# Altium schematic sheet SDR_LO.SchDoc
size B; SheetNumber: 2; SheetTotal: 4
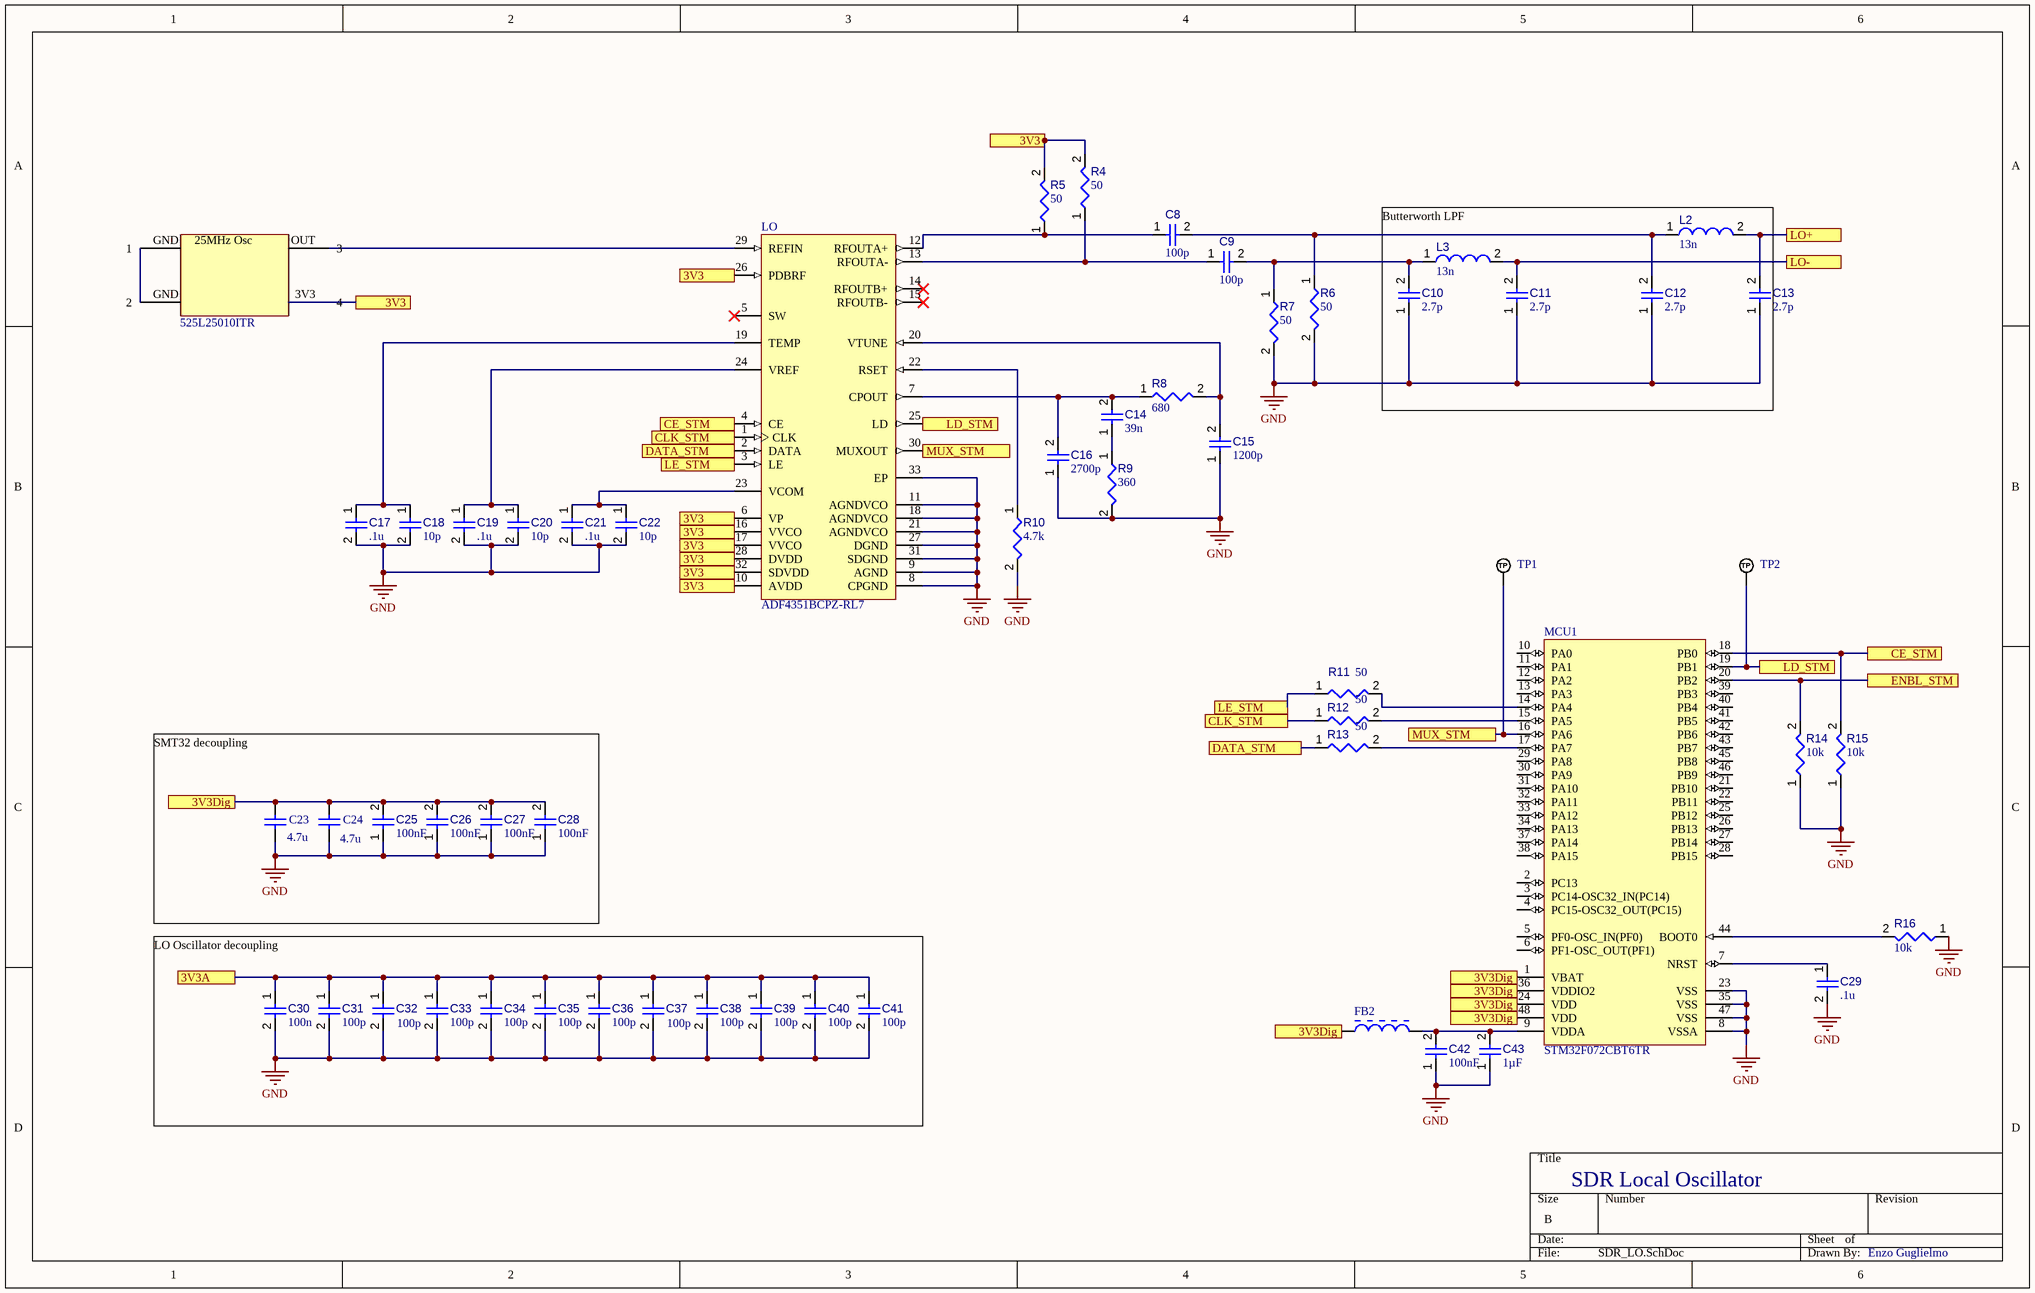
[diagram p0: SDR_LO.SchDoc]

## Parts
*  525L25010ITR
C8  value 100p  [CAPC0402(1005)60_L]  (hidden comment: Capacitor 100nF +/-20% 25V 0402)
C9  value 100p  [CAPC0402(1005)60_L]  (hidden comment: Capacitor 100nF +/-20% 25V 0402)
C10  value 2.7p  [CAPC0402(1005)60_L]  (hidden comment: Capacitor 100nF +/-20% 25V 0402)
C11  value 2.7p  [CAPC0402(1005)60_L]  (hidden comment: Capacitor 100nF +/-20% 25V 0402)
C12  value 2.7p  [CAPC0402(1005)60_L]  (hidden comment: Capacitor 100nF +/-20% 25V 0402)
C13  value 2.7p  [CAPC0402(1005)60_L]  (hidden comment: Capacitor 100nF +/-20% 25V 0402)
C14  value 39n  [CAPC0402(1005)60_L]  (hidden comment: Capacitor 100nF +/-20% 25V 0402)
C15  value 1200p  [CAPC0402(1005)60_L]  (hidden comment: Capacitor 100nF +/-20% 25V 0402)
C16  value 2700p  [CAPC0402(1005)60_L]  (hidden comment: Capacitor 100nF +/-20% 25V 0402)
C17  value .1u  [CAPC0402(1005)60_L]  (hidden comment: Capacitor 100nF +/-20% 25V 0402)
C18  value 10p  [CAPC0402(1005)60_L]  (hidden comment: Capacitor 100nF +/-20% 25V 0402)
C19  value .1u  [CAPC0402(1005)60_L]  (hidden comment: Capacitor 100nF +/-20% 25V 0402)
C20  value 10p  [CAPC0402(1005)60_L]  (hidden comment: Capacitor 100nF +/-20% 25V 0402)
C21  value .1u  [CAPC0402(1005)60_L]  (hidden comment: Capacitor 100nF +/-20% 25V 0402)
C22  value 10p  [CAPC0402(1005)60_L]  (hidden comment: Capacitor 100nF +/-20% 25V 0402)
C23  4.7u  [WCAP-CSGP_0402_L1W0.5H0.5]
C24  4.7u  [WCAP-CSGP_0402_L1W0.5H0.5]
C25  value 100nF  [CAPC0402(1005)60_L]  (hidden comment: Capacitor 100nF +/-20% 10V 0402)
C26  value 100nF  [CAPC0402(1005)60_L]  (hidden comment: Capacitor 100nF +/-20% 10V 0402)
C27  value 100nF  [CAPC0402(1005)60_L]  (hidden comment: Capacitor 100nF +/-20% 10V 0402)
C28  value 100nF  [CAPC0402(1005)60_L]  (hidden comment: Capacitor 100nF +/-20% 10V 0402)
C29  value .1u  [CAPC0402(1005)60_L]  (hidden comment: Capacitor 100nF +/-20% 25V 0402)
C30  value 100n  [CAPC0402(1005)60_L]  (hidden comment: Capacitor 100nF +/-20% 25V 0402)
C31  value 100p  [CAPC0402(1005)60_L]  (hidden comment: Capacitor 100nF +/-20% 25V 0402)
C32  value 100p  [CAPC0402(1005)60_L]  (hidden comment: Capacitor 100nF +/-20% 25V 0402)
C33  value 100p  [CAPC0402(1005)60_L]  (hidden comment: Capacitor 100nF +/-20% 25V 0402)
C34  value 100p  [CAPC0402(1005)60_L]  (hidden comment: Capacitor 100nF +/-20% 25V 0402)
C35  value 100p  [CAPC0402(1005)60_L]  (hidden comment: Capacitor 100nF +/-20% 25V 0402)
C36  value 100p  [CAPC0402(1005)60_L]  (hidden comment: Capacitor 100nF +/-20% 25V 0402)
C37  value 100p  [CAPC0402(1005)60_L]  (hidden comment: Capacitor 100nF +/-20% 25V 0402)
C38  value 100p  [CAPC0402(1005)60_L]  (hidden comment: Capacitor 100nF +/-20% 25V 0402)
C39  value 100p  [CAPC0402(1005)60_L]  (hidden comment: Capacitor 100nF +/-20% 25V 0402)
C40  value 100p  [CAPC0402(1005)60_L]  (hidden comment: Capacitor 100nF +/-20% 25V 0402)
C41  value 100p  [CAPC0402(1005)60_L]  (hidden comment: Capacitor 100nF +/-20% 25V 0402)
C42  value 100nF  [CAPC0402(1005)60_L]  (hidden comment: Capacitor 100nF +/-20% 10V 0402)
C43  value 1µF  [CAPC0402(1005)60_L]  (hidden comment: Capacitor 1µF +/-20% 10V 0402)
FB2  BLM21PG331SN1D  [INDC2013X105X50ML20T20]  (value not drawn)
L2  value 13n  [IND1005X55X20VL5T10]  (hidden comment: ELJ-RF2N2DFB)
L3  value 13n  [IND1005X55X20VL5T10]  (hidden comment: ELJ-RF2N2DFB)
LO  ADF4351BCPZ-RL7  [ADI-CP-32-2_L]
MCU1  STM32F072CBT6TR  [STM-LQFP48_M]
R4  value 50  [RESC1005X40X25ML05T05]  (hidden comment: Resistor 100k +/-1% 0402 63 mW)
R5  value 50  [RESC1005X40X25ML05T05]  (hidden comment: Resistor 100k +/-1% 0402 63 mW)
R6  value 50  [RESC1005X40X25ML05T05]  (hidden comment: Resistor 100k +/-1% 0402 63 mW)
R7  value 50  [RESC1005X40X25ML05T05]  (hidden comment: Resistor 100k +/-1% 0402 63 mW)
R8  value 680  [RESC1005X40X25ML05T05]  (hidden comment: Resistor 100k +/-1% 0402 63 mW)
R9  value 360  [RESC1005X40X25ML05T05]  (hidden comment: Resistor 100k +/-1% 0402 63 mW)
R10  value 4.7k  [RESC1005X40X25ML05T05]  (hidden comment: Resistor 100k +/-1% 0402 63 mW)
R11  value 50  [RESC1005X40X25ML05T05]  (hidden comment: Resistor 100k +/-1% 0402 63 mW)
R12  value 50  [RESC1005X40X25ML05T05]  (hidden comment: Resistor 100k +/-1% 0402 63 mW)
R13  value 50  [RESC1005X40X25ML05T05]  (hidden comment: Resistor 100k +/-1% 0402 63 mW)
R14  value 10k  [RESC1005X40X25ML05T05]  (hidden comment: Resistor 100k +/-1% 0402 63 mW)
R15  value 10k  [RESC1005X40X25ML05T05]  (hidden comment: Resistor 100k +/-1% 0402 63 mW)
R16  value 10k  [RESC1005X40X25ML05T05]  (hidden comment: Resistor 100k +/-1% 0402 63 mW)
TP1  TP_NOBOM  [PAD_RND_1MM]  (value not drawn)  (no BOM)
TP2  TP_NOBOM  [PAD_RND_1MM]  (value not drawn)  (no BOM)

## Ports
3V3 (see SDR_LO[2A], SDR_LO[3A], SDR_LO[3B]), 3V3 (see SDR_LO[3A], SDR_LO[3B]), 3V3A (see SDR_Power[2C]), 3V3Dig (see SDR_LO[1C], SDR_LO[4D], SDR_LO[5D], SDR_Power[2D]), 3V3Dig (see SDR_LO[1C], SDR_LO[5D], SDR_Power[2D]), 3V3Dig (see SDR_LO[4D], SDR_LO[5D], SDR_Power[2D]), CE_STM (see SDR_LO[2B]), CE_STM (see SDR_LO[6C]), CLK_STM (see SDR_LO[2B]), CLK_STM (see SDR_LO[4C]), DATA_STM (see SDR_LO[2B]), DATA_STM (see SDR_LO[4C]), ENBL_STM (see SDR_Tuner[3A]), LD_STM (see SDR_LO[3B]), LD_STM (see SDR_LO[6C]), LE_STM (see SDR_LO[2B]), LE_STM (see SDR_LO[4C]), LO+ (see SDR_Tuner[3A]), LO- (see SDR_Tuner[3A]), MUX_STM (see SDR_LO[3B]), MUX_STM (see SDR_LO[5C])

## Nets
GND: C10.1 C11.1 C12.1 C13.1 C15.1 C16.1 C17.2 C18.2 C19.2 C20.2 C21.2 C22.2 C23.1 C24.1 C25.1 C26.1 C27.1 C28.1 C29.2 C30.2 C31.2 C32.2 C33.2 C34.2 C35.2 C36.2 C37.2 C38.2 C39.2 C40.2 C41.2 C42.1 C43.1 LO.8(CPGND) LO.9(AGND) LO.11(AGNDVCO) LO.18(AGNDVCO) LO.21(AGNDVCO) LO.27(DGND) LO.31(SDGND) LO.33(EP) MCU1.8(VSSA) MCU1.23(VSS) MCU1.35(VSS) MCU1.47(VSS) R6.2 R7.2 R9.2 R10.2 R14.1 R15.1 R16.1
3V3: *.3V3(4) LO.6(VP) LO.10(AVDD) LO.16(VVCO) LO.17(VVCO) LO.26(PDBRF) LO.28(DVDD) LO.32(SDVDD) R4.2 R5.2 ; port 3V3
3V3A: C30.1 C31.1 C32.1 C33.1 C34.1 C35.1 C36.1 C37.1 C38.1 C39.1 C40.1 C41.1 ; port 3V3A
3V3Dig: C23.2 C24.2 C25.2 C26.2 C27.2 C28.2 FB2.1 MCU1.1(VBAT) MCU1.24(VDD) MCU1.36(VDDIO2) MCU1.48(VDD) ; port 3V3Dig
CE_STM: LO.4(CE) MCU1.18(PB0) R15.2 ; port CE_STM
CLK_STM: LO.1(CLK) R12.1 ; port CLK_STM
DATA_STM: LO.2(DATA) R13.1 ; port DATA_STM
ENBL_STM: MCU1.20(PB2) R14.2 ; port ENBL_STM
LD_STM: LO.25(LD) MCU1.19(PB1) TP2.1(TP) ; port LD_STM
LE_STM: LO.3(LE) R11.1 ; port LE_STM
LO+: C13.2 L2.2 ; port LO+
LO-: C11.2 L3.2 ; port LO-
MUX_STM: LO.30(MUXOUT) MCU1.16(PA6) TP1.1(TP) ; port MUX_STM
NetC8_1: C8.1 LO.12(RFOUTA+) R5.1
NetC8_2: C8.2 C12.2 L2.1 R6.1
NetC9_1: C9.1 LO.13(RFOUTA-) R4.1
NetC9_2: C9.2 C10.2 L3.1 R7.1
NetC14_1: C14.1 R9.1
NetC14_2: C14.2 C16.2 LO.7(CPOUT) R8.1
NetC15_2: C15.2 LO.20(VTUNE) R8.2
NetC17_1: C17.1 C18.1 LO.19(TEMP)
NetC19_1: C19.1 C20.1 LO.24(VREF)
NetC21_1: C21.1 C22.1 LO.23(VCOM)
NetC29_1: C29.1 MCU1.7(NRST)
NetC42_2: C42.2 C43.2 FB2.2 MCU1.9(VDDA)
NetLO_22: LO.22(RSET) R10.1
NetMCU1_14: MCU1.14(PA4) R11.2
NetMCU1_15: MCU1.15(PA5) R12.2
NetMCU1_17: MCU1.17(PA7) R13.2
NetMCU1_44: MCU1.44(BOOT0) R16.2

Not connected (* = marked no-connect by the designer): * GND(2) OUT(3); LO 5(SW)* 14(RFOUTB+)* 15(RFOUTB-)* 29(REFIN); MCU1 2(PC13) 3(PC14-OSC32_IN(PC14)) 4(PC15-OSC32_OUT(PC15)) 5(PF0-OSC_IN(PF0)) 6(PF1-OSC_OUT(PF1)) 10(PA0) 11(PA1) 12(PA2) 13(PA3) 21(PB10) 22(PB11) 25(PB12) 26(PB13) 27(PB14) 28(PB15) 29(PA8) 30(PA9) 31(PA10) 32(PA11) 33(PA12) 34(PA13) 37(PA14) 38(PA15) 39(PB3) 40(PB4) 41(PB5) 42(PB6) 43(PB7) 45(PB8) 46(PB9)

## Notes on the sheet
- Butterworth LPF
- SMT32 decoupling
- LO Oscillator decoupling
- SDR Local Oscillator
- Enzo Guglielmo
- (in symbol 525L25010ITR) 25MHz Osc

## Library data of the parts
* = 525L25010ITR: 25 MHz TCXO Clipped Sine Wave Oscillator 3.3V 4-SMD, No Lead
C8-C22 C29-C41 = CMP-001-00065-4: Chip Capacitor, 100nF +/-20%, 25V, 0402, Thickness 0.6 mm; Tolerance: 10%; Max Operating Temperature: 85°C; Min Operating Temperature: -55°C; Pins: 2; Voltage Rating: 25V; Mounting Technology: SMT; Case/Package: 0402
C23 C24 = CMP-207839-000027-3: Cap, Mlcc, 4.7UF, 6.3V, X5R, 0402 Rohs Compliant: Yes; Insulation Resistance: 20MΩ; Capacitance: 4.7µF; Material: Ceramic; Tolerance: 20%; Case Code (Metric): 1005; Case/Package: 0402; Case Code (Imperial): 0402; RoHS: Compliant; Voltage Rating (DC): 6.3V; Thickness: 558.8µm; Dielectric: X5R; REACH SVHC: Unknown; Voltage Rating: 6.3V; Width: 500µm; Max Operating Temperature: 85°C; Height: 500µm; Mount: Surface Mount; Min Operating Temperature: -55°C; Length: 1mm
C25-C28 C42 = CMP-001-00061-3: Chip Capacitor, 100nF +/-20%, 10V, 0402, Thickness 0.6 mm; Tolerance: 20%; Mounting Technology: SMT; Voltage Rating: 10V; Max Operating Temperature: 85°C; Pins: 2; Case/Package: 0402; Min Operating Temperature: -55°C
C43 = CMP-001-00063-3: Chip Capacitor, 1µF +/-20%, 10V, 0402, Thickness 0.6 mm; Tolerance: 10%; Mounting Technology: SMT; Max Operating Temperature: 85°C; Voltage Rating: 10V; Pins: 2; Case/Package: 0402; Min Operating Temperature: -55°C
FB2 = CMP-006-00000-3: IND, Chip Ferrite Bead, 330 Ohm, +/- 25%, 1.5 A, -55 to 125 degC, 0805 (2012 Metric), Tape and Reel; Manufacturer: Murata; Current Rating: 1.5A; Impedance: 330Ohm; Resistance: 90mohm; Max Operating Temperature: 125°C; Core Material: Ferrite; Case/Package: 0805; Mounting Technology: SM; Datasheet URL: http://psearch.en.murata.com/inductor/product/LQG15HS15NJ02_.pdf; Packaging: TapeandReel; Min Operating Temperature: -55°C; RoHS Compliant: True; Max Current Rating: 1.5A; Datasheet Version: Nov-11; Package Quantity: 4000; Package Reference: 0805; Package Description: 2-Pin Surface Mount Device, Body 2 x1.25 mm; Tolerance: 25%
L2 L3 = CMP-006-00006-6: Chip Inductor, 2.2 nH, +/- 0.3 nH, 400 mA, -40 to 85 degC, 0402 (1005 Metric), RoHS, Tape and Reel; Manufacturer: Panasonic; Shielding: Unshielded; Current Rating: 400mA; Tolerance: 5%; Core Material: Ceramic; Q Factor: 8; Datasheet URL: http://www.bourns.com/docs/Product-Datasheets/cm322522.pdf; Case/Package: 0402; RoHS Compliant: True; Package Description: 2-Pin Surface Mount Device, Body 1 x 0.5 mm; Packaging: TapeandReel; Datasheet Version: Sep-12; Package Quantity: 10000; Package Reference: 0402; Min Operating Temperature: -20°C; Mounting Technology: SM; Max Operating Temperature: 85°C
LO = CMP-0287-00015-1: Wideband Synthesizer with Integrated VCO, CP-32-2, Pb-Free, 1500 Reel; Max RF Input (MHz): 4.4GHz; RF Prescalers: 4/5,8/9; Max REFin (MHz): 250MHz; Frequency Range: 35MHz-4.4GHz; Norm Phase Noise (dBc/Hz): -221dBc; Supply Current: 110mA; Single/Dual: Single; PackageVersion: Jan-2005; ComponentLink3URL: http://www.analog.com/static/imported-files/packages/414143737956480539664569CP_32_2.pdf; PackageReference: CP-32-2; ComponentLink2URL: http://www.analog.com/static/imported-files/data_sheets/ADF4351.pdf; ComponentLink1URL: www.analog.com; ComponentLink1Description: Manufacturer URL; ComponentLink2Description: Datasheet; ComponentLink3Description: Package Specification; PackageDescription: 32-Lead Lead Frame Chip Scale Package [LFCSP_VQ]; DatasheetVersion: Rev. Pr D; Code_JEDEC: MO-220-VHHD-2
MCU1 = CMP-0304-00171-1: ARM Cortex-M0 32-bit MCU, 128 KB Flash, 16 KB Internal RAM, 37 I/Os, 48-Pin LQFP, -40 to 85 degC, Tape and Reel; FLASH Size (Prog) (kB): 128; D/A Converter: 1; Operating Frequency(F) (Processor speed) (MHz): 48; Supply Voltage(Vcc) min (V): 2; I/Os (High Current): 37; Internal RAM Size (kB): 16; ComponentLink1URL: http://www.st.com/; DatasheetVersion: Rev. 5; Mounting Technology: Surface Mount; Packing: Tape and Reel; ComponentLink2Description: Datasheet; ComponentLink2URL: http://www.st.com/st-web-ui/static/active/en/resource/technical/document/datasheet/DM00090510.pdf; ComponentLink1Description: Manufacturer URL; Package Reference: LQFP48; Core: ARM Cortex-M0; Package Description: 48-Pin Low Profile Quad Flat Package, Body 7 x 7 mm, Pitch 0.5 mm
R4-R16 = CMP-009-00021-5: Chip Resistor, 100 KOhm, +/- 1%, 0.063 W, -55 to 155 degC, 0402 (1005 Metric); Voltage Rating: 50V; Power: 63mW; Pins: 2; Tolerance: 1%; Max Operating Temperature: 155°C; Case/Package: 0402; Min Operating Temperature: -55°C; Mounting Technology: SM; RoHS Compliant: True
TP1 TP2 = TEST_POINT_RND_1MM: Test Point Round 1mm (NO BOM)